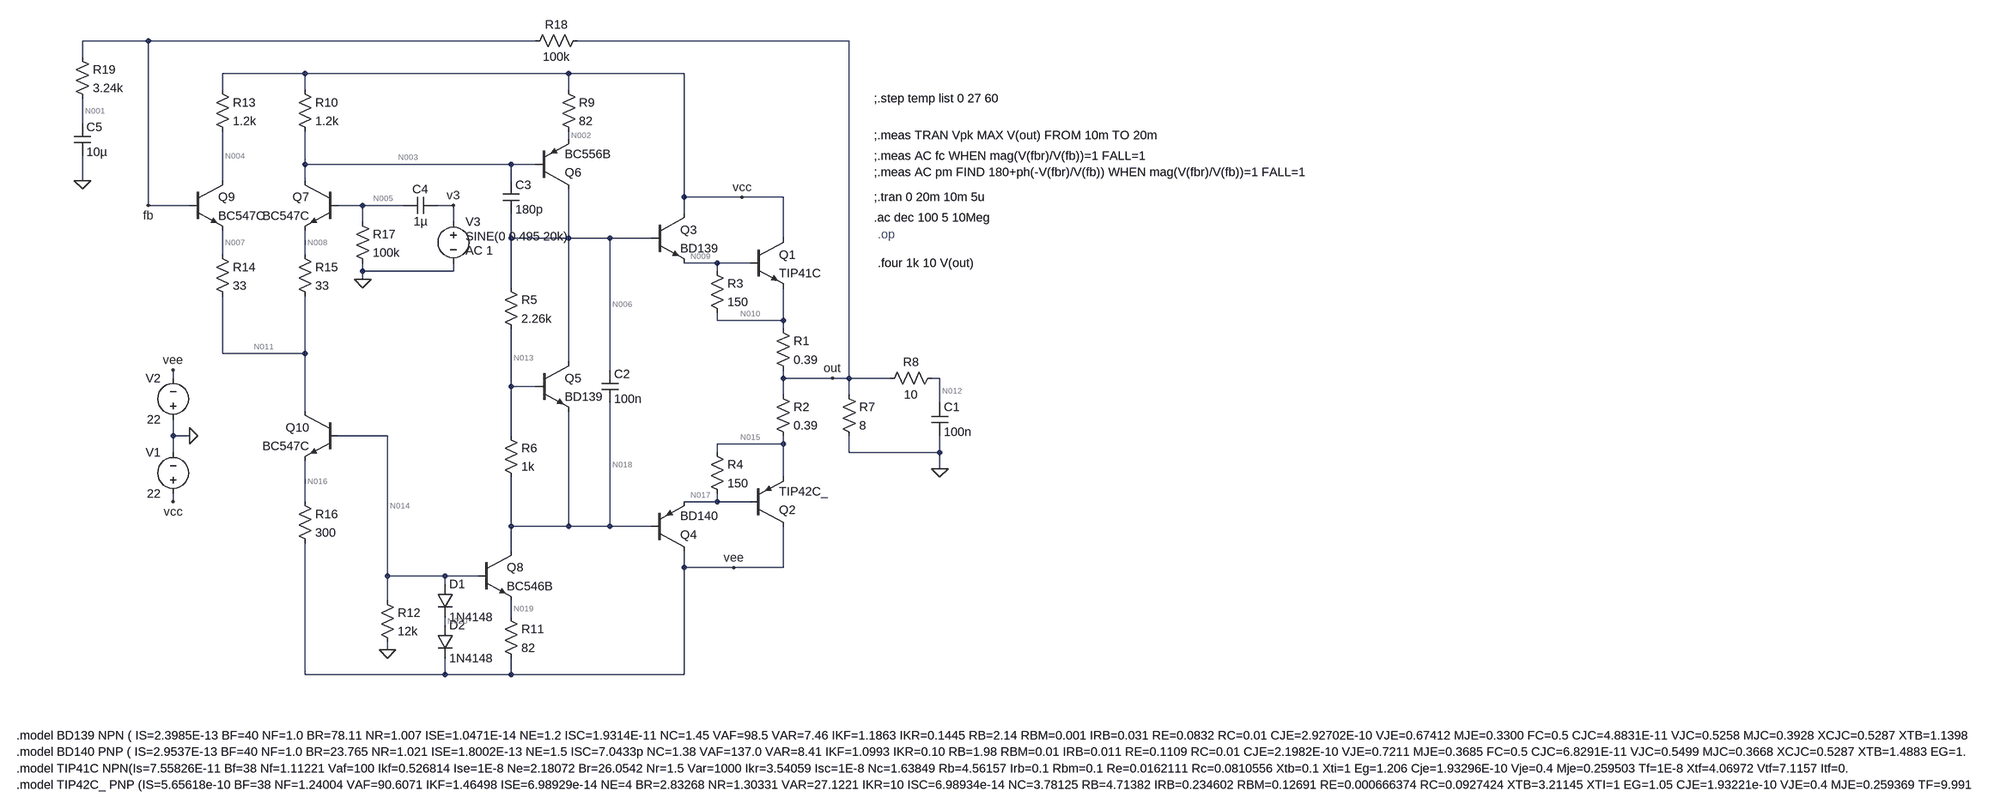
[diagram p0: schematic Amplificador.asc]
Amplificador.asc, the LTspice schematic file:
Version 4.1
SHEET 1 5476 1440
WIRE -2208 -64 -2336 -64
WIRE -1456 -64 -2208 -64
WIRE -848 -64 -1376 -64
WIRE -2336 -32 -2336 -64
WIRE -1904 0 -2064 0
WIRE -1392 0 -1904 0
WIRE -1168 0 -1392 0
WIRE -2064 32 -2064 0
WIRE -1904 32 -1904 0
WIRE -1392 32 -1392 0
WIRE -2336 96 -2336 48
WIRE -1392 128 -1392 112
WIRE -1904 176 -1904 112
WIRE -1504 176 -1904 176
WIRE -1456 176 -1504 176
WIRE -2336 208 -2336 160
WIRE -2064 208 -2064 112
WIRE -1904 208 -1904 176
WIRE -1504 208 -1504 176
WIRE -1168 240 -1168 0
WIRE -1056 240 -1168 240
WIRE -976 240 -1056 240
WIRE -2208 256 -2208 -64
WIRE -2128 256 -2208 256
WIRE -1792 256 -1840 256
WIRE -1712 256 -1792 256
WIRE -1616 256 -1648 256
WIRE -1168 272 -1168 240
WIRE -1792 288 -1792 256
WIRE -1616 288 -1616 256
WIRE -1504 320 -1504 272
WIRE -1392 320 -1392 224
WIRE -1392 320 -1504 320
WIRE -1312 320 -1392 320
WIRE -1232 320 -1312 320
WIRE -976 320 -976 240
WIRE -2064 352 -2064 304
WIRE -1904 352 -1904 304
WIRE -1104 368 -1168 368
WIRE -1040 368 -1104 368
WIRE -1792 384 -1792 368
WIRE -1616 384 -1616 368
WIRE -1616 384 -1792 384
WIRE -1104 384 -1104 368
WIRE -1792 400 -1792 384
WIRE -1504 416 -1504 320
WIRE -1104 480 -1104 464
WIRE -976 480 -976 416
WIRE -976 480 -1104 480
WIRE -976 496 -976 480
WIRE -2064 544 -2064 432
WIRE -1904 544 -1904 432
WIRE -1904 544 -2064 544
WIRE -1392 560 -1392 320
WIRE -1312 576 -1312 320
WIRE -2160 592 -2160 576
WIRE -976 592 -976 576
WIRE -880 592 -976 592
WIRE -848 592 -848 -64
WIRE -848 592 -880 592
WIRE -768 592 -848 592
WIRE -672 592 -688 592
WIRE -1504 608 -1504 496
WIRE -1456 608 -1504 608
WIRE -976 624 -976 592
WIRE -848 624 -848 592
WIRE -672 640 -672 592
WIRE -1904 656 -1904 544
WIRE -2160 704 -2160 672
WIRE -2128 704 -2160 704
WIRE -1744 704 -1840 704
WIRE -1504 704 -1504 608
WIRE -976 720 -976 704
WIRE -976 720 -1104 720
WIRE -2160 736 -2160 704
WIRE -1104 736 -1104 720
WIRE -848 736 -848 704
WIRE -672 736 -672 704
WIRE -672 736 -848 736
WIRE -672 768 -672 736
WIRE -976 784 -976 720
WIRE -2160 832 -2160 816
WIRE -1904 832 -1904 752
WIRE -1104 832 -1104 816
WIRE -1104 832 -1168 832
WIRE -1040 832 -1104 832
WIRE -1504 880 -1504 784
WIRE -1392 880 -1392 656
WIRE -1392 880 -1504 880
WIRE -1312 880 -1312 640
WIRE -1312 880 -1392 880
WIRE -1232 880 -1312 880
WIRE -1504 928 -1504 880
WIRE -1168 960 -1168 928
WIRE -1072 960 -1168 960
WIRE -976 960 -976 880
WIRE -976 960 -1072 960
WIRE -1744 976 -1744 704
WIRE -1632 976 -1744 976
WIRE -1568 976 -1632 976
WIRE -1632 992 -1632 976
WIRE -1744 1024 -1744 976
WIRE -1504 1056 -1504 1024
WIRE -1632 1072 -1632 1056
WIRE -1744 1120 -1744 1104
WIRE -1904 1168 -1904 912
WIRE -1632 1168 -1632 1136
WIRE -1632 1168 -1904 1168
WIRE -1504 1168 -1504 1136
WIRE -1504 1168 -1632 1168
WIRE -1168 1168 -1168 960
WIRE -1168 1168 -1504 1168
FLAG -1056 240 vcc
FLAG -1072 960 vee
FLAG -1792 400 0
FLAG -1616 256 v3
FLAG -672 768 0
FLAG -2128 704 0
FLAG -2160 576 vee
FLAG -2160 832 vcc
FLAG -1744 1120 0
FLAG -2336 208 0
FLAG -2208 256 fb
FLAG -880 592 out
SYMBOL res -992 480 R0
SYMATTR InstName R1
SYMATTR Value 0.39
SYMBOL res -992 608 R0
SYMATTR InstName R2
SYMATTR Value 0.39
SYMBOL npn -1040 320 R0
SYMATTR InstName Q1
SYMATTR Value TIP41C
SYMBOL pnp -1040 880 M180
SYMATTR InstName Q2
SYMATTR Value TIP42C_
SYMBOL res -1120 368 R0
SYMATTR InstName R3
SYMATTR Value 150
SYMBOL res -1120 720 R0
SYMATTR InstName R4
SYMATTR Value 150
SYMBOL npn -1232 272 R0
SYMATTR InstName Q3
SYMATTR Value BD139
SYMBOL pnp -1232 928 M180
SYMATTR InstName Q4
SYMATTR Value BD140
SYMBOL npn -1456 560 R0
SYMATTR InstName Q5
SYMATTR Value BD139
SYMBOL res -1520 400 R0
SYMATTR InstName R5
SYMATTR Value 2.26k
SYMBOL res -1520 688 R0
SYMATTR InstName R6
SYMATTR Value 1k
SYMBOL voltage -2160 832 R180
WINDOW 0 24 96 Left 2
WINDOW 3 24 16 Left 2
WINDOW 123 0 0 Left 0
WINDOW 39 0 0 Left 0
SYMATTR InstName V1
SYMATTR Value 22
SYMBOL voltage -2160 688 R180
WINDOW 0 24 96 Left 2
WINDOW 3 24 16 Left 2
WINDOW 123 0 0 Left 0
WINDOW 39 0 0 Left 0
SYMATTR InstName V2
SYMATTR Value 22
SYMBOL res -864 608 R0
SYMATTR InstName R7
SYMATTR Value 8
SYMBOL res -672 576 R90
WINDOW 0 0 56 VBottom 2
WINDOW 3 32 56 VTop 2
SYMATTR InstName R8
SYMATTR Value 10
SYMBOL cap -688 640 R0
SYMATTR InstName C1
SYMATTR Value 100n
SYMBOL pnp -1456 224 M180
SYMATTR InstName Q6
SYMATTR Value BC556B
SYMBOL res -1408 16 R0
SYMATTR InstName R9
SYMATTR Value 82
SYMBOL cap -1328 576 R0
SYMATTR InstName C2
SYMATTR Value 100n
SYMBOL npn -1568 928 R0
SYMATTR InstName Q8
SYMATTR Value BC546B
SYMBOL res -1520 1040 R0
SYMATTR InstName R11
SYMATTR Value 82
SYMBOL res -1920 16 R0
SYMATTR InstName R10
SYMATTR Value 1.2k
SYMBOL cap -1520 208 R0
SYMATTR InstName C3
SYMATTR Value 180p
SYMBOL diode -1648 992 R0
SYMATTR InstName D1
SYMATTR Value 1N4148
SYMBOL diode -1648 1072 R0
SYMATTR InstName D2
SYMATTR Value 1N4148
SYMBOL res -1760 1008 R0
SYMATTR InstName R12
SYMATTR Value 12k
SYMBOL npn -1840 208 M0
SYMATTR InstName Q7
SYMATTR Value BC547C
SYMBOL npn -2128 208 R0
SYMATTR InstName Q9
SYMATTR Value BC547C
SYMBOL npn -1840 656 M0
SYMATTR InstName Q10
SYMATTR Value BC547C
SYMBOL res -2080 16 R0
SYMATTR InstName R13
SYMATTR Value 1.2k
SYMBOL res -2080 336 R0
SYMATTR InstName R14
SYMATTR Value 33
SYMBOL res -1920 336 R0
SYMATTR InstName R15
SYMATTR Value 33
SYMBOL res -1920 816 R0
SYMATTR InstName R16
SYMATTR Value 300
SYMBOL res -1808 272 R0
SYMATTR InstName R17
SYMATTR Value 100k
SYMBOL voltage -1616 272 R0
WINDOW 3 24 44 Left 2
WINDOW 123 24 72 Left 2
WINDOW 39 0 0 Left 0
SYMATTR Value SINE(0 0.495 20k)
SYMATTR Value2 AC 1
SYMATTR InstName V3
SYMBOL cap -1648 240 R90
WINDOW 0 0 32 VBottom 2
WINDOW 3 32 32 VTop 2
SYMATTR InstName C4
SYMATTR Value 1µ
SYMBOL res -1360 -80 R90
WINDOW 0 0 56 VBottom 2
WINDOW 3 32 56 VTop 2
SYMATTR InstName R18
SYMATTR Value 100k
SYMBOL res -2352 -48 R0
SYMATTR InstName R19
SYMATTR Value 3.24k
SYMBOL cap -2352 96 R0
SYMATTR InstName C5
SYMATTR Value 10µ
TEXT -792 368 Left 2 !.four 1k 10 V(out)
TEXT -800 160 Left 2 !;.meas AC fc WHEN mag(V(fbr)/V(fb))=1 FALL=1\n;.meas AC pm FIND 180+ph(-V(fbr)/V(fb)) WHEN mag(V(fbr)/V(fb))=1 FALL=1
TEXT -800 280 Left 2 !.ac dec 100 5 10Meg
TEXT -800 120 Left 2 !;.meas TRAN Vpk MAX V(out) FROM 10m TO 20m
TEXT -792 312 Left 2 ;.op
TEXT -800 240 Left 2 !;.tran 0 20m 10m 5u
TEXT -800 48 Left 2 !;.step temp list 0 27 60
TEXT -2464 1328 Left 2 !.model BD139 NPN ( IS=2.3985E-13 BF=40 NF=1.0 BR=78.11 NR=1.007 ISE=1.0471E-14 NE=1.2 ISC=1.9314E-11 NC=1.45 VAF=98.5 VAR=7.46 IKF=1.1863 IKR=0.1445 RB=2.14 RBM=0.001 IRB=0.031 RE=0.0832 RC=0.01 CJE=2.92702E-10 VJE=0.67412 MJE=0.3300 FC=0.5 CJC=4.8831E-11 VJC=0.5258 MJC=0.3928 XCJC=0.5287 XTB=1.1398 EG=1.2105 XTI=3.0 Vceo=80 Icrating=3 mfg=fairchild)
TEXT -2464 1360 Left 2 !.model BD140 PNP ( IS=2.9537E-13 BF=40 NF=1.0 BR=23.765 NR=1.021 ISE=1.8002E-13 NE=1.5 ISC=7.0433p NC=1.38 VAF=137.0 VAR=8.41 IKF=1.0993 IKR=0.10 RB=1.98 RBM=0.01 IRB=0.011 RE=0.1109 RC=0.01 CJE=2.1982E-10 VJE=0.7211 MJE=0.3685 FC=0.5 CJC=6.8291E-11 VJC=0.5499 MJC=0.3668 XCJC=0.5287 XTB=1.4883 EG=1.2343 XTI=3.0 Vceo=80 Icrating=3 mfg=fairchild)
TEXT -2464 1392 Left 2 !.model TIP41C NPN(Is=7.55826E-11 Bf=38 Nf=1.11221 Vaf=100 Ikf=0.526814 Ise=1E-8 Ne=2.18072 Br=26.0542 Nr=1.5 Var=1000 Ikr=3.54059 Isc=1E-8 Nc=1.63849 Rb=4.56157 Irb=0.1 Rbm=0.1 Re=0.0162111 Rc=0.0810556 Xtb=0.1 Xti=1 Eg=1.206 Cje=1.93296E-10 Vje=0.4 Mje=0.259503 Tf=1E-8 Xtf=4.06972 Vtf=7.1157 Itf=0.001 Cjc=1.09657E-10 Vjc=0.730921 Mjc=0.23 Xcjc=0.803085 Fc=0.8 Cjs=0 Vjs=0.75 Mjs=0.5 Tr=9.01013E-8 Ptf=0 Kf=0 Af=1 Vceo=100 Icrating=6 mfg=OnSemi)
TEXT -2464 1424 Left 2 !.model TIP42C_ PNP (IS=5.65618e-10 BF=38 NF=1.24004 VAF=90.6071 IKF=1.46498 ISE=6.98929e-14 NE=4 BR=2.83268 NR=1.30331 VAR=27.1221 IKR=10 ISC=6.98934e-14 NC=3.78125 RB=4.71382 IRB=0.234602 RBM=0.12691 RE=0.000666374 RC=0.0927424 XTB=3.21145 XTI=1 EG=1.05 CJE=1.93221e-10 VJE=0.4 MJE=0.259369 TF=9.99163e-09 XTF=4.41941 VTF=6.53488 ITF=0.001 CJC=1.0962e-10 VJC=0.731968 MJC=0.23 XCJC=0.799902 FC=0.799995 TR=1e-07 PTF=0 KF=0 Vceo=100 ICrating=6 mfg=ON_Semi)

The netlist it stands for:
* Amplificador.asc
R1 N010 out 0.39
R2 out N015 0.39
Q1 vcc N009 N010 0 TIP41C
Q2 vee N017 N015 0 TIP42C_
R3 N009 N010 150
R4 N015 N017 150
Q3 vcc N006 N009 0 BD139
Q4 vee N018 N017 0 BD140
Q5 N006 N013 N018 0 BD139
R5 N006 N013 2.26k
R6 N013 N018 1k
V1 vcc 0 22
V2 0 vee 22
R7 out 0 8
R8 N012 out 10
C1 N012 0 100n
Q6 N006 N003 N002 0 BC556B
R9 vcc N002 82
C2 N006 N018 100n
Q8 N018 N014 N019 0 BC546B
R11 N019 vee 82
R10 vcc N003 1.2k
C3 N003 N006 180p
D1 N014 N020 1N4148
D2 N020 vee 1N4148
R12 N014 0 12k
Q7 N003 N005 N008 0 BC547C
Q9 N004 fb N007 0 BC547C
Q10 N011 N014 N016 0 BC547C
R13 vcc N004 1.2k
R14 N007 N011 33
R15 N008 N011 33
R16 N016 vee 300
R17 N005 0 100k
V3 v3 0 SINE(0 0.495 20k) AC 1
C4 v3 N005 1µ
R18 out fb 100k
R19 fb N001 3.24k
C5 N001 0 10µ
.model D D
.lib standard.dio
.model NPN NPN
.model PNP PNP
.lib standard.bjt
.four 1k 10 V(out)
;.meas AC fc WHEN mag(V(fbr)/V(fb))=1 FALL=1
;.meas AC pm FIND 180+ph(-V(fbr)/V(fb)) WHEN mag(V(fbr)/V(fb))=1 FALL=1
.ac dec 100 5 10Meg
;.meas TRAN Vpk MAX V(out) FROM 10m TO 20m
* .op
;.tran 0 20m 10m 5u
;.step temp list 0 27 60
.model BD139 NPN ( IS=2.3985E-13 BF=40 NF=1.0 BR=78.11 NR=1.007 ISE=1.0471E-14 NE=1.2 ISC=1.9314E-11 NC=1.45 VAF=98.5 VAR=7.46 IKF=1.1863 IKR=0.1445 RB=2.14 RBM=0.001 IRB=0.031 RE=0.0832 RC=0.01 CJE=2.92702E-10 VJE=0.67412 MJE=0.3300 FC=0.5 CJC=4.8831E-11 VJC=0.5258 MJC=0.3928 XCJC=0.5287 XTB=1.1398 EG=1.2105 XTI=3.0 Vceo=80 Icrating=3 mfg=fairchild)
.model BD140 PNP ( IS=2.9537E-13 BF=40 NF=1.0 BR=23.765 NR=1.021 ISE=1.8002E-13 NE=1.5 ISC=7.0433p NC=1.38 VAF=137.0 VAR=8.41 IKF=1.0993 IKR=0.10 RB=1.98 RBM=0.01 IRB=0.011 RE=0.1109 RC=0.01 CJE=2.1982E-10 VJE=0.7211 MJE=0.3685 FC=0.5 CJC=6.8291E-11 VJC=0.5499 MJC=0.3668 XCJC=0.5287 XTB=1.4883 EG=1.2343 XTI=3.0 Vceo=80 Icrating=3 mfg=fairchild)
.model TIP41C NPN(Is=7.55826E-11 Bf=38 Nf=1.11221 Vaf=100 Ikf=0.526814 Ise=1E-8 Ne=2.18072 Br=26.0542 Nr=1.5 Var=1000 Ikr=3.54059 Isc=1E-8 Nc=1.63849 Rb=4.56157 Irb=0.1 Rbm=0.1 Re=0.0162111 Rc=0.0810556 Xtb=0.1 Xti=1 Eg=1.206 Cje=1.93296E-10 Vje=0.4 Mje=0.259503 Tf=1E-8 Xtf=4.06972 Vtf=7.1157 Itf=0.001 Cjc=1.09657E-10 Vjc=0.730921 Mjc=0.23 Xcjc=0.803085 Fc=0.8 Cjs=0 Vjs=0.75 Mjs=0.5 Tr=9.01013E-8 Ptf=0 Kf=0 Af=1 Vceo=100 Icrating=6 mfg=OnSemi)
.model TIP42C_ PNP (IS=5.65618e-10 BF=38 NF=1.24004 VAF=90.6071 IKF=1.46498 ISE=6.98929e-14 NE=4 BR=2.83268 NR=1.30331 VAR=27.1221 IKR=10 ISC=6.98934e-14 NC=3.78125 RB=4.71382 IRB=0.234602 RBM=0.12691 RE=0.000666374 RC=0.0927424 XTB=3.21145 XTI=1 EG=1.05 CJE=1.93221e-10 VJE=0.4 MJE=0.259369 TF=9.99163e-09 XTF=4.41941 VTF=6.53488 ITF=0.001 CJC=1.0962e-10 VJC=0.731968 MJC=0.23 XCJC=0.799902 FC=0.799995 TR=1e-07 PTF=0 KF=0 Vceo=100 ICrating=6 mfg=ON_Semi)
.backanno
.end

* Results of the author's LTspice run, read from the files saved beside the schematic
* Operating Point, zero values left out:
*   V(fb) = -162.9 mV
*   V(n001) = -162.9 mV
*   V(n002) = 21.47 V
*   V(n003) = 20.8 V
*   V(n004) = 20.87 V
*   V(n005) = -159 mV
*   V(n006) = 1.176 V
*   V(n007) = -774.4 mV
*   V(n008) = -772.3 mV
*   V(n009) = 566.1 mV
*   V(n010) = -1.31 mV
*   V(n011) = -805.6 mV
*   V(n012) = -14.01 mV
*   V(n013) = -579.1 mV
*   V(n014) = -20.78 V
*   V(n015) = -27.4 mV
*   V(n016) = -21.41 V
*   V(n017) = -595.1 mV
*   V(n018) = -1.199 V
*   V(n019) = -21.47 V
*   V(n020) = -21.39 V
*   V(out) = -14.01 mV
*   V(vcc) = 22 V
*   V(vee) = -22 V
*   I(D1) = 1.711 mA
*   I(D2) = 1.711 mA
*   I(R1) = 32.57 mA
*   I(R10) = 997.5 µA
*   I(R11) = 6.524 mA
*   I(R12) = -1.732 mA
*   I(R13) = 944.6 µA
*   I(R14) = 946.1 µA
*   I(R15) = 1.01 mA
*   I(R16) = 1.959 mA
*   I(R17) = -1.59 µA
*   I(R18) = 1.489 µA
*   I(R2) = 34.32 mA
*   I(R3) = 3.783 mA
*   I(R4) = 3.785 mA
*   I(R5) = 776.5 µA
*   I(R6) = 620.3 µA
*   I(R7) = -1.751 mA
*   I(R9) = 6.519 mA
*   I(V1) = -40.92 mA
*   I(V2) = -44.41 mA
*   Ib(Q1) = 849 µA
*   Ib(Q10) = 3.14 µA
*   Ib(Q2) = -657.7 µA
*   Ib(Q3) = 104 µA
*   Ib(Q4) = -101.9 µA
*   Ib(Q5) = 156.1 µA
*   Ib(Q6) = -10.53 µA
*   Ib(Q7) = 1.59 µA
*   Ib(Q8) = 17.96 µA
*   Ib(Q9) = 1.489 µA
*   Ic(Q1) = 27.94 mA
*   Ic(Q10) = 1.956 mA
*   Ic(Q2) = -29.88 mA
*   Ic(Q3) = 4.528 mA
*   Ic(Q4) = -4.341 mA
*   Ic(Q5) = 5.628 mA
*   Ic(Q6) = -6.508 mA
*   Ic(Q7) = 1.008 mA
*   Ic(Q8) = 6.506 mA
*   Ic(Q9) = 944.6 µA
*   Ie(Q1) = -28.78 mA
*   Ie(Q10) = -1.959 mA
*   Ie(Q2) = 30.53 mA
*   Ie(Q3) = -4.632 mA
*   Ie(Q4) = 4.443 mA
*   Ie(Q5) = -5.784 mA
*   Ie(Q6) = 6.519 mA
*   Ie(Q7) = -1.01 mA
*   Ie(Q8) = -6.524 mA
*   Ie(Q9) = -946.1 µA
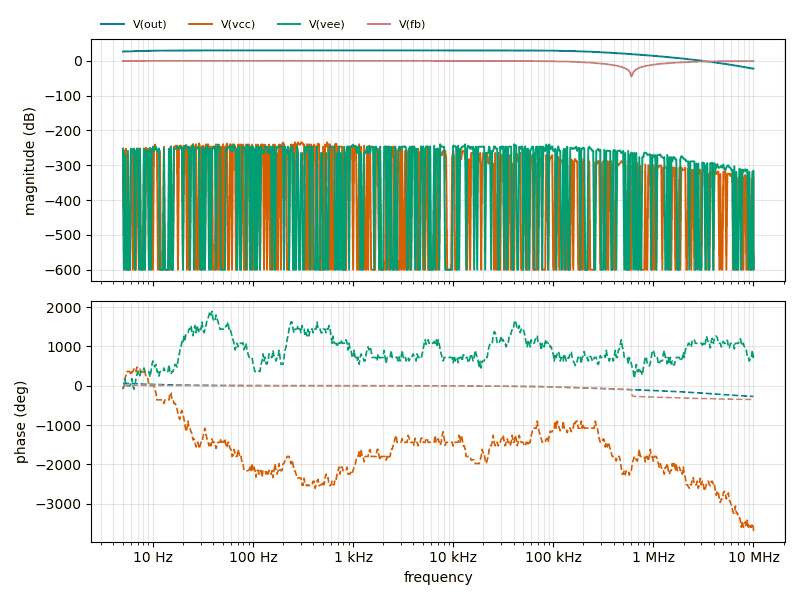
[diagram p1: AC Analysis of Amplificador.asc, plotted from the saved traces]
* AC Analysis, 1 run:
*   V(out): 26.49 dB at 5 Hz, -22.68 dB at 10 MHz, peak 29.79 dB at 1.069 kHz, 3 dB below the peak at 5.3 Hz and 201.7 kHz
*   V(vcc): -252.87 dB at 5 Hz, -337.15 dB at 10 MHz, peak -234.54 dB at 548.2 Hz, 3 dB below the peak at 545.2 Hz and 554.3 Hz
*   V(vee): -252.46 dB at 5 Hz, -316.08 dB at 10 MHz, peak -239.85 dB at 7.396 kHz, 3 dB below the peak at 7.394 kHz and 7.469 kHz
*   V(fb): -0.63 dB at 5 Hz, -0.81 dB at 10 MHz, peak -0.27 dB at 523.6 Hz, 3 dB below the peak at 170.9 kHz